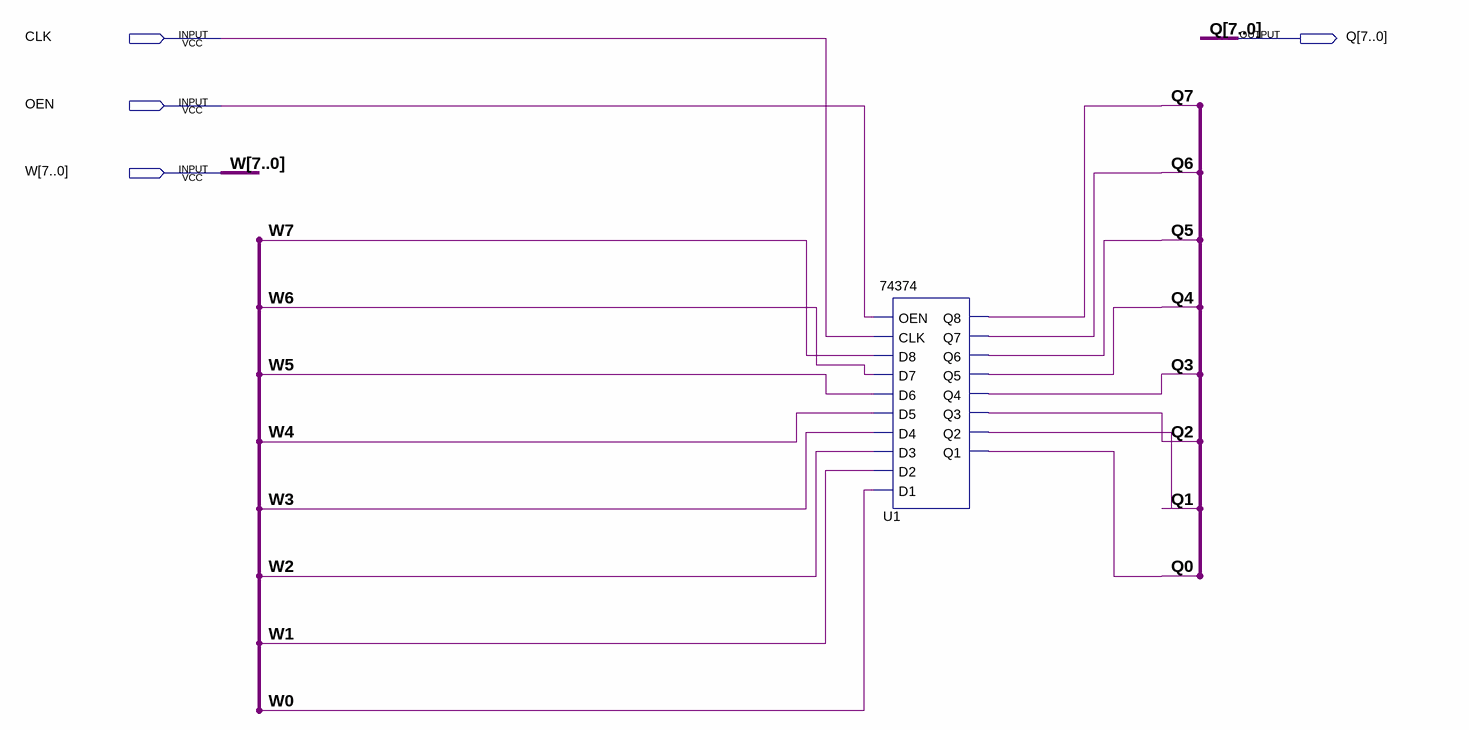
[diagram p0: schematic sheet]
// Quartus schematic probe_reg.bdf as structural Verilog: 1 symbols, 4 pins
module probe_reg (
  input  CLK,
  input  OEN,
  input  [7:0] W,
  output [7:0] Q
);

  \74374  U1 (
    .OEN(OEN), .CLK(CLK), .D8(W[7]), .D7(W[6]), .D6(W[5]), .D5(W[4]), .D4(W[3]), .D3(W[2]), .D2(W[1]),
    .D1(W[0]), .Q8(Q[7]), .Q7(Q[6]), .Q6(Q[5]), .Q5(Q[4]), .Q4(Q[3]), .Q3(Q[2]), .Q2(Q[1]), .Q1(Q[0]));
endmodule
